# Altium project AM_radio_device.PrjPcb
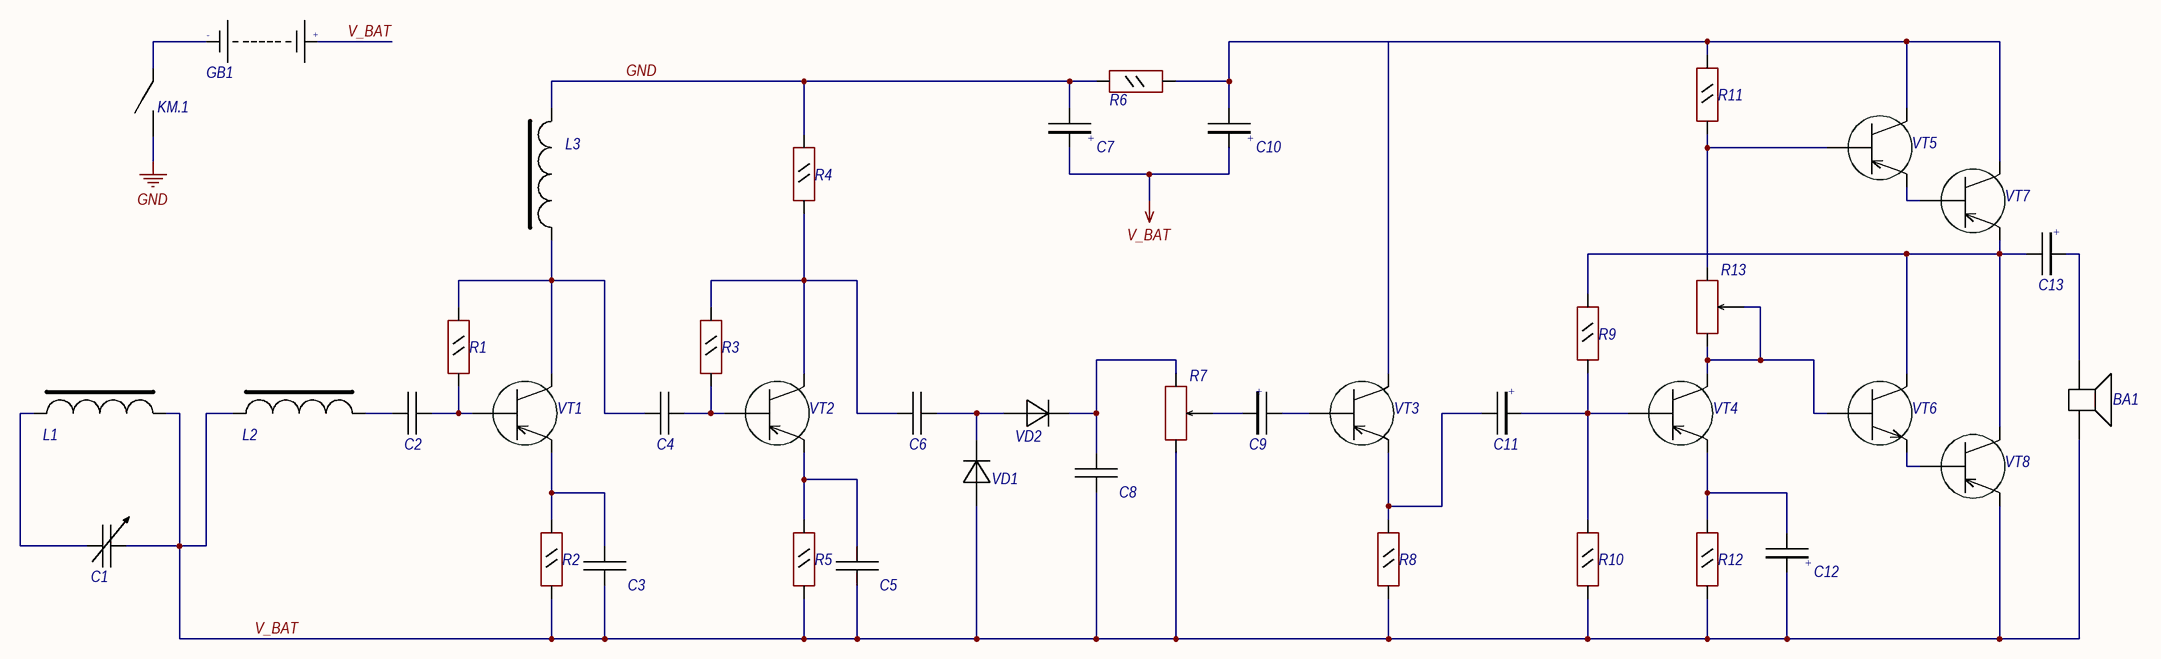
[diagram p0: AM.SchDoc]
1 sheet, 42 parts. Net scope: global (net labels, ports and power ports of the same name join across sheets).
Board file: PCB1_AM.PcbDoc

## Sheet AM.SchDoc
size 420 x 297 mm; SheetNumber: 1; SheetTotal: 1

### Parts
BA1  Speaker  [speaker]  (value not drawn)
C1  CV  [ANY_Condenser]  (value not drawn)
C2  Capacitor  [ANY_Condenser]  (value not drawn)
C3  Capacitor  [ANY_Condenser]  (value not drawn)
C4  Capacitor  [ANY_Condenser]  (value not drawn)
C5  Capacitor  [ANY_Condenser]  (value not drawn)
C6  Capacitor  [ANY_Condenser]  (value not drawn)
C7  Cp  [any_polar_condenser]  (value not drawn)
C8  Capacitor  [ANY_Condenser]  (value not drawn)
C9  Cp  [any_polar_condenser]  (value not drawn)
C10  Cp  [any_polar_condenser]  (value not drawn)
C11  Cp  [any_polar_condenser]  (value not drawn)
C12  Cp  [any_polar_condenser]  (value not drawn)
C13  Cp  [any_polar_condenser]  (value not drawn)
GB1  BatteryBig  [Power]  (value not drawn)
KM.1  Button  [ANY_SWITCHER]  (value not drawn)
L1  Inductor(with coil)  [ANY_INDUCTOR]  (value not drawn)
L2  Inductor(with coil)  [ANY_INDUCTOR]  (value not drawn)
L3  Inductor(with coil)  [ANY_INDUCTOR]  (value not drawn)
R1  R2W  [MLT0.125]  (value not drawn)
R2  R2W  [MLT0.125]  (value not drawn)
R3  R2W  [MLT0.125]  (value not drawn)
R4  R2W  [MLT0.125]  (value not drawn)
R5  R2W  [MLT0.125]  (value not drawn)
R6  R2W  [MLT0.125]  (value not drawn)
R7  RVariable  [any_var_res]  (value not drawn)
R8  R2W  [MLT0.125]  (value not drawn)
R9  R2W  [MLT0.125]  (value not drawn)
R10  R2W  [MLT0.125]  (value not drawn)
R11  R2W  [MLT0.125]  (value not drawn)
R12  R2W  [MLT0.125]  (value not drawn)
R13  RVariable  [any_var_res]  (value not drawn)
VD1  Diode  [kd522b]  (value not drawn)
VD2  Diode  [kd522b]  (value not drawn)
VT1  VTb(pnp)  [KTU-3-4]  (value not drawn)
VT2  VTb(pnp)  [KTU-3-4]  (value not drawn)
VT3  VTb(pnp)  [KTU-3-6]  (value not drawn)
VT4  VTb(pnp)  [KTU-3-6]  (value not drawn)
VT5  VTb(pnp)  [KTU-3-6]  (value not drawn)
VT6  VTb(npn)  [KTU-3-6]  (value not drawn)
VT7  VTb(pnp)  [KTU-3-6]  (value not drawn)
VT8  VTb(pnp)  [KTU-3-6]  (value not drawn)

### Nets
GND: C7.1 KM.1.2 L3.2 R4.2 R6.2
V_BAT: BA1.2 C1.2 C3.1 C5.1 C7.2 C8.1 C10.2 C12.2 GB1.2 L1.2 L2.1 R2.1 R5.1 R7.2 R8.1 R10.1 R12.1 VD1.1 VT8.2
NetBA1_1: BA1.1 C13.2
NetC1_1: C1.1 L1.1
NetC2_1: C2.1 L2.2
NetC2_2: C2.2 R1.1 VT1.1
NetC3_2: C3.2 R2.2 VT1.2
NetC4_1: C4.1 L3.1 R1.2 VT1.3
NetC4_2: C4.2 R3.1 VT2.1
NetC5_2: C5.2 R5.2 VT2.2
NetC6_1: C6.1 R3.2 R4.1 VT2.3
NetC6_2: C6.2 VD1.2 VD2.1
NetC8_2: C8.2 R7.1 VD2.2
NetC9_1: C9.1 VT3.1
NetC9_2: C9.2 R7.3
NetC10_1: C10.1 R6.1 R11.2 VT3.3 VT5.3 VT7.3
NetC11_1: C11.1 R8.2 VT3.2
NetC11_2: C11.2 R9.1 R10.2 VT4.1
NetC12_1: C12.1 R12.2 VT4.2
NetC13_1: C13.1 R9.2 VT6.3 VT7.2 VT8.3
NetGB1_1: GB1.1 KM.1.1
NetR11_1: R11.1 R13.1 VT5.1
NetR13_2: R13.2 R13.3 VT4.3 VT6.1
NetVT5_2: VT5.2 VT7.1
NetVT6_2: VT6.2 VT8.1

### Notes on the sheet
- THIS DOCUMENT AND THE DATA DISCLOSED HEREIN OR
- HEREWITH IS THE PROPERTY OF ALTIUM LIMITED AND MAY
- DWG NO:
- REVISION
- REV:
- DESCRIPTION
- DATE
- APPROVED
- BE FREELY DISTRIBUTED IN WHOLE. NO RIGHTS ARE
- RESERVED OR EXPRESS OR IMPLIED WARANTEE GIVEN.
- ENG:
- APPROVALS
- PROJECT
- DSN:
- CHK:
- REFERENCE DOCUMENTS
- PROJECT REVISION:
- TITLE
- DOCUMENT REVISION:
- DESIGN ITEM:
- BOM:
- FAB DWG:
- PCB DWG:
- ASSY DWG:
- SCALE:
- A3
- SIZE
- CAGE CODE
- FILE NAME
- DWG NO.
- SHEET
- OF
- REV
- (in symbol BatteryBig) -; +
- (in symbol Cp) +